# Altium schematic sheet PYLink.SchDoc: PYLink
size A3; DrawnBy: lcg; Revision: V2.0; SheetNumber: 2; SheetTotal: 7; Project: PY32F403v1xT_START
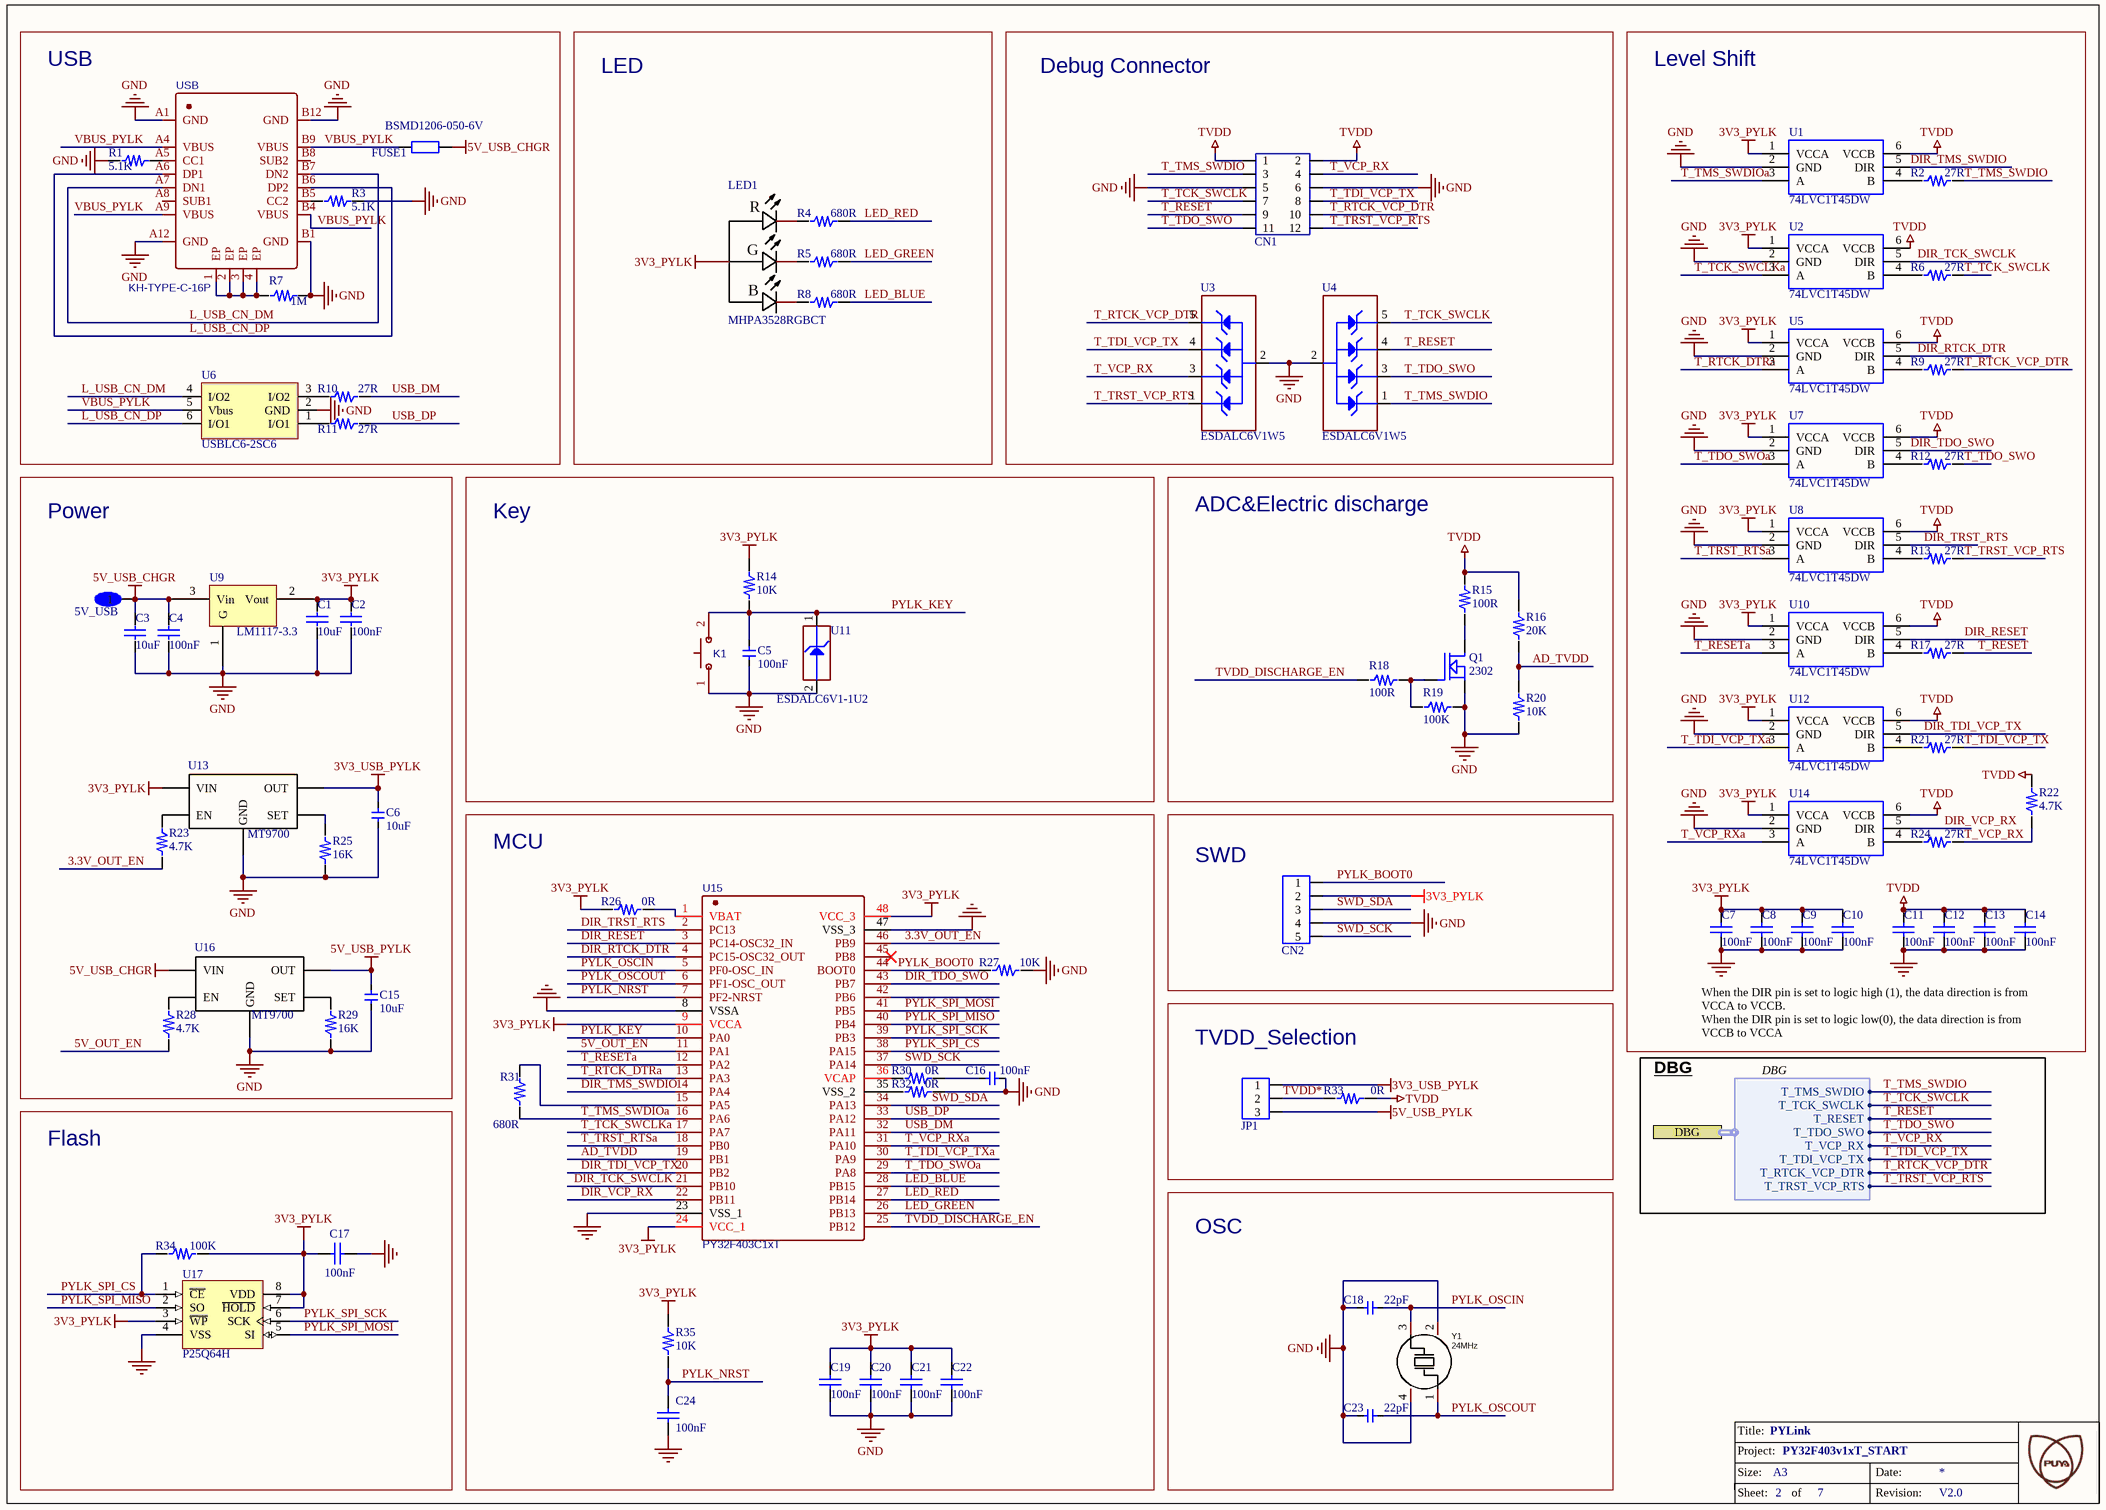
[diagram p0: PYLink.SchDoc]

## Parts
5V_USB  TP_SIN  [TP_SIN]  (value not drawn)
C1  10uF  [C0805]
C2  100nF  [C0603]
C3  10uF  [C0805]
C4  100nF  [C0603]
C5  100nF  [C0603]
C6  10uF  [C0805]
C7  100nF  [C0603]
C8  100nF  [C0603]
C9  100nF  [C0603]
C10  100nF  [C0603]
C11  100nF  [C0603]
C12  100nF  [C0603]
C13  100nF  [C0603]
C14  100nF  [C0603]
C15  10uF  [C0805]
C16  100nF  [C0603]
C17  100nF  [C0603]
C18  22pF  [C0603]
C19  100nF  [C0603]
C20  100nF  [C0603]
C21  100nF  [C0603]
C22  100nF  [C0603]
C23  22pF  [C0603]
C24  100nF  [C0603]
CN1  CON6x2  [CON6x2]  (value not drawn)
CN2  CON5  [CON5]  (value not drawn)
FUSE1  BSMD1206-050-6V  [SDM1210P005TF]
JP1  CON3  [CON3]  (value not drawn)
K1  1TS002B-2600-5001_key  [Switch]  (value not drawn)
LED1  MHPA3528RGBCT  [LED-ARRAY-SMD_4P-L3.5-W2.8-TL]
Q1  2302  [SOT23]
R1  5.1K  [R0603]
R2  27R  [R0603]
R3  5.1K  [R0603]
R4  680R  [R0603]
R5  680R  [R0603]
R6  27R  [R0603]
R7  1M  [R0603]
R8  680R  [R0603]
R9  27R  [R0603]
R10  27R  [R0603]
R11  27R  [R0603]
R12  27R  [R0603]
R13  27R  [R0603]
R14  10K  [R0603]
R15  100R  [R0805]
R16  20K  [R0603]
R17  27R  [R0603]
R18  100R  [R0603]
R19  100K  [R0603]
R20  10K  [R0603]
R21  27R  [R0603]
R22  4.7K  [R0603]
R23  4.7K  [R0603]
R24  27R  [R0603]
R25  16K  [R0603]
R26  0R  [R0603]
R27  10K  [R0603]
R28  4.7K  [R0603]
R29  16K  [R0603]
R30  0R  [R0603]
R31  680R  [R0603]
R32  0R  [R0603]
R33  0R  [R0603]
R34  100K  [R0603]
R35  10K  [R0603]
U1  74LVC1T45DW  [SOT363]
U2  74LVC1T45DW  [SOT363]
U3  value ESDALC6V1W5  [ESD_SOT323-5L]  (hidden comment: ESD_6V1)
U4  value ESDALC6V1W5  [ESD_SOT323-5L]  (hidden comment: ESD_6V1)
U5  74LVC1T45DW  [SOT363]
U6  USBLC6-2SC6  [SOT23-6]
U7  74LVC1T45DW  [SOT363]
U8  74LVC1T45DW  [SOT363]
U9  LM1117-3.3  [LM1117-3.3]
U10  74LVC1T45DW  [SOT363]
U11  value ESDALC6V1-1U2  [ESD_ST0201]  (hidden comment: ESD-TRANSIL)
U12  74LVC1T45DW  [SOT363]
U13  MT9700  [SOT23-5]
U14  74LVC1T45DW  [SOT363]
U15  PY32F403C1xT  [LQFP-48_L7.0-W7.0-P0.50-LS9.0-BL]
U16  MT9700  [SOT23-5]
U17  P25Q64H  [SOP-8P]
USB  KH-TYPE-C-16P  [USB-C-SMD_KH-TYPE-C-16P]
Y1  24MHz  [CRYSTAL-SMD_4P-L3.2-W2.5-BL]

## Blocks framed on the sheet
USB: FUSE1 R1 R3 R7 R10 R11 U6 USB
LED: LED1 R4 R5 R8
Debug Connector: CN1 U3 U4
Level Shift: C7-C14 R2 R6 R9 R12 R13 R17 R21 R22 R24 U1 U2 U5 U7 U8 U10 U12 U14
Power: 5V_USB C1-C4 C6 C15 R23 R25 R28 R29 U9 U13 U16
Key: C5 K1 R14 U11
ADC&Electric discharge: Q1 R15 R16 R18-R20
MCU: C16 C19-C22 C24 R26 R27 R30-R32 R35 U15
SWD: CN2
TVDD_Selection: JP1 R33
Flash: C17 R34 U17
OSC: C18 C23 Y1

## Ports
DBG (harness DBG)

## Harnesses
DBG: T_VCP_RX, T_TDO_SWO, T_RESET, T_TMS_SWDIO, T_TDI_VCP_TX, T_TCK_SWCLK, T_RTCK_VCP_DTR, T_TRST_VCP_RTS

## Nets
3V3_PYLK: C1.2 C2.2 C7.2 C8.2 C9.2 C10.2 C17.2 C19.2 C20.2 C21.2 C22.2 CN2.2 LED1.1(-) R14.2 R26.1 R34.2 R35.2 U1.1(VCCA) U2.1(VCCA) U5.1(VCCA) U7.1(VCCA) U8.1(VCCA) U9.2(Vout) U10.1(VCCA) U12.1(VCCA) U13.5(VIN) U14.1(VCCA) U15.9(VCCA) U15.24(VCC_1) U15.48(VCC_3) U17.3(~{WP}) U17.7(~{HOLD}) U17.8(VDD)
3V3_USB_PYLK: C6.2 JP1.1 U13.1(OUT)
5V_USB_CHGR: 5V_USB.1 C3.2 C4.2 FUSE1.2 U9.3(Vin) U16.5(VIN)
5V_USB_PYLK: C15.2 JP1.3 U16.1(OUT)
GND: C1.1 C2.1 C3.1 C4.1 C5.1 C6.1 C7.1 C8.1 C9.1 C10.1 C11.1 C12.1 C13.1 C14.1 C15.1 C16.1 C17.1 C18.1 C19.1 C20.1 C21.1 C22.1 C23.1 C24.1 CN1.5 CN1.6 CN2.4 K1.1(A) Q1.2(S) R1.1 R3.2 R7.2 R19.1 R20.1 R25.1 R27.2 R29.1 R32.2 U1.2(GND) U2.2(GND) U3.2(GND) U4.2(GND) U5.2(GND) U6.2(GND) U7.2(GND) U8.2(GND) U9.1(G) U10.2(GND) U11.2(GND) U12.2(GND) U13.2(GND) U14.2(GND) U15.8(VSSA) U15.23(VSS_1) U15.47(VSS_3) U16.2(GND) U17.4(VSS) USB.A1(GND) USB.A12(GND) USB.B1(GND) USB.B12(GND) Y1.2(GND) Y1.4(GND)
TVDD: C11.2 C12.2 C13.2 C14.2 CN1.1 CN1.2 R15.2 R16.2 R22.2 R33.2 U1.6(VCCB) U2.6(VCCB) U5.6(VCCB) U7.6(VCCB) U8.6(VCCB) U10.6(VCCB) U12.6(VCCB) U14.6(VCCB)
3.3V_OUT_EN: R23.1 U15.46(PB9)
5V_OUT_EN: R28.1 U15.11(PA1)
AD_TVDD: R16.1 R20.2 U15.19(PB1)
DIR_RESET: U10.5(DIR) U15.3(PC14-OSC32_IN)
DIR_RTCK_DTR: U5.5(DIR) U15.4(PC15-OSC32_OUT)
DIR_TCK_SWCLK: U2.5(DIR) U15.21(PB10)
DIR_TDI_VCP_TX: U12.5(DIR) U15.20(PB2)
DIR_TDO_SWO: U7.5(DIR) U15.43(PB7)
DIR_TMS_SWDIO: U1.5(DIR) U15.14(PA4)
DIR_TRST_RTS: U8.5(DIR) U15.2(PC13)
DIR_VCP_RX: U14.5(DIR) U15.22(PB11)
L_USB_CN_DM: U6.4(I/O2) USB.A7(DN1) USB.B7(DN2)
L_USB_CN_DP: U6.6(I/O1) USB.A6(DP1) USB.B6(DP2)
LED_BLUE: R8.2 U15.28(PB15)
LED_GREEN: R5.2 U15.26(PB13)
LED_RED: R4.2 U15.27(PB14)
PYLK_BOOT0: CN2.1 R27.1 U15.44(BOOT0)
PYLK_KEY: C5.2 K1.2(B) R14.1 U11.1(IO1) U15.10(PA0)
PYLK_NRST: C24.2 R35.1 U15.7(PF2-NRST)
PYLK_OSCIN: C18.2 U15.5(PF0-OSC_IN) Y1.3(OSC2)
PYLK_OSCOUT: C23.2 U15.6(PF1-OSC_OUT) Y1.1(OSC1)
PYLK_SPI_CS: R34.1 U15.38(PA15) U17.1(~{CE})
PYLK_SPI_MISO: U15.40(PB4) U17.2(SO)
PYLK_SPI_MOSI: U15.41(PB5) U17.5(SI)
PYLK_SPI_SCK: U15.39(PB3) U17.6(SCK)
SWD_SCK: CN2.5 U15.37(PA14)
SWD_SDA: CN2.3 U15.34(PA13)
T_RESET: CN1.9 R17.2 U4.4(IO3) ; port DBG.T_RESET
T_RESETa: U10.3(A) U15.12(PA2)
T_RTCK_DTRa: U5.3(A) U15.13(PA3)
T_RTCK_VCP_DTR: CN1.10 R9.2 U3.5(IO4) ; port DBG.T_RTCK_VCP_DTR
T_TCK_SWCLK: CN1.7 R6.2 U4.5(IO4) ; port DBG.T_TCK_SWCLK
T_TCK_SWCLKa: U2.3(A) U15.17(PA7)
T_TDI_VCP_TX: CN1.8 R21.2 U3.4(IO3) ; port DBG.T_TDI_VCP_TX
T_TDI_VCP_TXa: U12.3(A) U15.30(PA9)
T_TDO_SWO: CN1.11 R12.2 U4.3(IO2) ; port DBG.T_TDO_SWO
T_TDO_SWOa: U7.3(A) U15.29(PA8)
T_TMS_SWDIO: CN1.3 R2.2 U4.1(IO1) ; port DBG.T_TMS_SWDIO
T_TMS_SWDIOa: R31.1 U1.3(A) U15.16(PA6)
T_TRST_RTSa: U8.3(A) U15.18(PB0)
T_TRST_VCP_RTS: CN1.12 R13.2 U3.1(IO1) ; port DBG.T_TRST_VCP_RTS
T_VCP_RX: CN1.4 R22.1 R24.2 U3.3(IO2) ; port DBG.T_VCP_RX
T_VCP_RXa: U14.3(A) U15.31(PA10)
TVDD*: JP1.2 R33.1
TVDD_DISCHARGE_EN: R18.2 U15.25(PB12)
USB_DM: R10.2 U15.32(PA11)
USB_DP: R11.2 U15.33(PA12)
VBUS_PYLK: FUSE1.1 U6.5(Vbus) USB.A4(VBUS) USB.A9(VBUS) USB.B4(VBUS) USB.B9(VBUS)
NetC16_2: C16.2 R30.2
NetLED1_2: LED1.2(-) R8.1
NetLED1_3: LED1.3(-) R5.1
NetLED1_4: LED1.4(-) R4.1
NetQ1_1: Q1.1(G) R18.1 R19.2
NetQ1_3: Q1.3(D) R15.1
NetR1_2: R1.2 USB.A5(CC1)
NetR2_1: R2.1 U1.4(B)
NetR3_1: R3.1 USB.B5(CC2)
NetR6_1: R6.1 U2.4(B)
NetR7_1: R7.1 USB.1(EP) USB.2(EP) USB.3(EP) USB.4(EP)
NetR9_1: R9.1 U5.4(B)
NetR10_1: R10.1 U6.3(I/O2)
NetR11_1: R11.1 U6.1(I/O1)
NetR12_1: R12.1 U7.4(B)
NetR13_1: R13.1 U8.4(B)
NetR17_1: R17.1 U10.4(B)
NetR21_1: R21.1 U12.4(B)
NetR23_2: R23.2 U13.4(EN)
NetR24_1: R24.1 U14.4(B)
NetR25_2: R25.2 U13.3(SET)
NetR26_2: R26.2 U15.1(VBAT)
NetR28_2: R28.2 U16.4(EN)
NetR29_2: R29.2 U16.3(SET)
NetR30_1: R30.1 U15.36(VCAP)
NetR31_2: R31.2 U15.15(PA5)
NetR32_1: R32.1 U15.35(VSS_2)

Not connected (* = marked no-connect by the designer): U15 42(PB6) 45(PB8)*; USB A8(SUB1) B8(SUB2)

## Notes on the sheet
- When the DIR pin is set to logic high (1), the data direction is from VCCA to VCCB.
  When the DIR pin is set to logic low(0), the data direction is from VCCB to VCCA
- DBG
- Title:
- Project:
- Size:
- Sheet:
- A3
- of
- Date:
- Revision:
- (in symbol MHPA3528RGBCT) R; G; B

## Library data of the parts
C1 C3 C6 C15 = C0805: PCB DECAL: 0805
C2 C4 C5 C16 C18 C23 = C0603: PCB DECAL: 0603
C7-C14 C17 C19-C22 C24 = 贴片高压陶瓷电容: Capacitor (Semiconductor SIM Model); 器件封装(外观): 0603; Value: 104
CN1 = CON6x2: PCB DECAL: CON5x2
FUSE1 = SMD1210P005TF: https://item.szlcsc.com/947797.html?fromZone=s_s__%25226V%2520500mA%2522; ComponentLink1Description: lichang; ComponentLink1URL: C883122
K1 = 1TS002B-2600-5001_key: BOM_Manufacturer: HYP; Contributor: LCSC; BOM_Supplier: LCSC; BOM_Supplier Part: C319334; BOM_Manufacturer Part: 1TS002B-2600-5001_KEY; BOM_JLCPCB Part Class: Extended Part; spicePre: S; spiceSymbolName: 1TS002B-2600-5001
LED1 = MHPA3528RGBCT: Manufacturer: MEIHUA(美华); Add into BOM: yes; Symbol: MHPA3528RGBCT; Device: MHPA3528RGBCT; LCSC Part Name: RGB三色; Supplier Part: C409779; Manufacturer Part: MHPA3528RGBCT; Supplier Footprint: SMD3528; JLCPCB Part Class: 扩展库; Datasheet: https://atta.szlcsc.com/upload/public/pdf/source/20190902/C409779_9EA0C46D876E94D2A4E683BAC3DDD702.pdf; Supplier: LCSC; Convert to PCB: yes; Name: MHPA3528RGBCT
Q1 = MOSFET N: Value: SI2302; 器件封装(外观): SOT23
R1-R14 R16-R35 = R0603: PCB DECAL: 0603
R15 = R0805: PCB DECAL: 0805
U3 U4 = ESDALC6V1W5: Dual Transil array for ESD protection; Internal_Part_Number: MCD-00136; Part_Type: Diode; Manufacturer: STMICROELECTRONICS; ECCN_US: EAR99; ECCN_EU: NEC; Provided_By: Subcon; Initial_Board_Reference: MB1262; Status: Released; Manufacturer_Part_Number: ESDALC6V1W5; ComponentLink1Description: STM_ESD_ESDALC6V1W5.pdf; ComponentLink1URL: http://tunmcdsvn.tun.st.com/Component_Datasheet_Library/Trunk/Diodes/STM_ESD_ESDALC6V1W5
U6 = USBLC6-2SC6: Function: ESD EMI fliter
U11 = ESD-TRANSIL: ESD protection 6V1; Internal_Part_Number: MCD-00170; Part_Type: Diode; Manufacturer: STMICROELECTRONICS; ECCN_US: EAR99; ECCN_EU: NEC; Provided_By: Subcon; Initial_Board_Reference: MB1274; Status: Released; Manufacturer_Part_Number: ESDALC6V1-1U2; ComponentLink1Description: STM_ESD_ESDALC6V1-1U2.pdf; ComponentLink1URL: http://tunmcdsvn.tun.st.com/Component_Datasheet_Library/Trunk/Diodes/STM_ESD_ESDALC6V1-1U2
U15 = PY32F403C1xT: LQFP48; BOM_Manufacturer: PUYA(普冉); BOM_Manufacturer Part: PY32F403C1xT; spicePre: U; spiceSymbolName: PY32F403C1xT
U17 = SST25VF010: Value: SST25VF020B; 器件封装(外观): SOP8
USB = KH-TYPE-C-16P: BOM_Manufacturer: Shenzhen Kinghelm Elec; Contributor: LCSC; BOM_Supplier: LCSC; BOM_Supplier Part: C709357; BOM_Manufacturer Part: KH-TYPE-C-16P; BOM_JLCPCB Part Class: Extended Part; spicePre: U; spiceSymbolName: KH-TYPE-C-16P
Y1 = ABM8AIG-24.000MHZ-82Z-T: ±20ppm , 12.5pF , T_use: -40°C~125°C; Manufacturer: ABRACON; Add into BOM: yes; External load capacitor: 8pF; Frequency Stability(Full temperature range): ±50ppm; Equivalent Series Resistance (ESR): 50Ω; Name: 24MHz; Symbol: ABM8AIG-24.000MHZ-82Z-T; Device: ABM8AIG-24.000MHZ-82Z-T; LCSC Part Name: 24MHz ±20ppm 8pF; Supplier Part: C1669761; Manufacturer Part: ABM8AIG-24.000MHZ-82Z-T; Supplier Footprint: SMD3225-4P; JLCPCB Part Class: Extended Part; Datasheet: https://atta.szlcsc.com/upload/public/pdf/source/20210326/C1986479_1F0B0D93791ADB7A90489BA856D17A98.pdf; Supplier: LCSC; Convert to PCB: yes; Value: 24MHz; Normal temperature Frequency Tolerance: ±20ppm; Operating Temperature: -40℃~+125℃